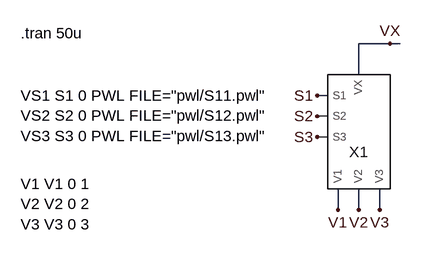
[diagram p0: schematic SW3_tb.asc]
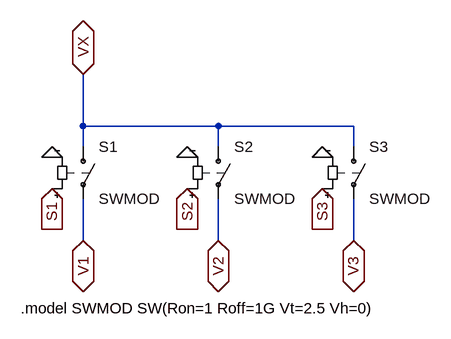
[diagram p1: sub-circuit sw3.asc]
SW3_tb.asc, the LTspice schematic file:
Version 4
SHEET 1 880 728
WIRE 224 64 176 64
WIRE 240 64 224 64
WIRE 176 112 176 64
WIRE 128 144 112 144
WIRE 128 176 112 176
WIRE 128 208 112 208
WIRE 144 320 144 288
WIRE 176 320 176 288
WIRE 208 320 208 288
FLAG 144 320 V1
FLAG 176 320 V2
FLAG 208 320 V3
FLAG 224 64 VX
FLAG 112 144 S1
FLAG 112 176 S2
FLAG 112 208 S3
SYMBOL SW3 176 192 R0
SYMATTR InstName X1
TEXT -344 48 Left 2 !.tran 50u
TEXT -344 144 Left 2 !VS1 S1 0 PWL FILE="pwl/S11.pwl"\nVS2 S2 0 PWL FILE="pwl/S12.pwl"\nVS3 S3 0 PWL FILE="pwl/S13.pwl"
TEXT -344 280 Left 2 !V1 V1 0 1\nV2 V2 0 2\nV3 V3 0 3

sw3.asc, the sub-circuit schematic file:
Version 4.1
SHEET 1 880 680
WIRE 128 96 128 16
WIRE 336 96 128 96
WIRE 544 96 336 96
WIRE 128 128 128 96
WIRE 336 128 336 96
WIRE 544 128 544 96
WIRE 128 272 128 208
WIRE 336 272 336 208
WIRE 544 272 544 208
FLAG 80 144 0
FLAG 288 144 0
FLAG 496 144 0
FLAG 80 192 S1
IOPIN 80 192 In
FLAG 288 192 S2
IOPIN 288 192 In
FLAG 496 192 S3
IOPIN 496 192 In
FLAG 128 272 V1
IOPIN 128 272 BiDir
FLAG 336 272 V2
IOPIN 336 272 BiDir
FLAG 544 272 V3
IOPIN 544 272 BiDir
FLAG 128 16 VX
IOPIN 128 16 BiDir
SYMBOL sw 128 112 R0
SYMATTR InstName S1
SYMATTR Value SWMOD
SYMBOL sw 336 112 R0
SYMATTR InstName S2
SYMATTR Value SWMOD
SYMBOL sw 544 112 R0
SYMATTR InstName S3
SYMATTR Value SWMOD
TEXT 32 376 Left 2 !.model SWMOD SW(Ron=1 Roff=1G Vt=2.5 Vh=0)

The netlist it stands for:
* SW3_tb.asc
XX1 S1 S2 S3 V1 V2 V3 VX sw3

* block symbol definitions
.subckt sw3 S1 S2 S3 V1 V2 V3 VX
S1 VX V1 S1 0 SWMOD
S2 VX V2 S2 0 SWMOD
S3 VX V3 S3 0 SWMOD
.model SWMOD SW(Ron=1 Roff=1G Vt=2.5 Vh=0)
.ends sw3

.tran 50u
VS1 S1 0 PWL FILE="pwl/S11.pwl"
VS2 S2 0 PWL FILE="pwl/S12.pwl"
VS3 S3 0 PWL FILE="pwl/S13.pwl"
V1 V1 0 1
V2 V2 0 2
V3 V3 0 3
.backanno
.end